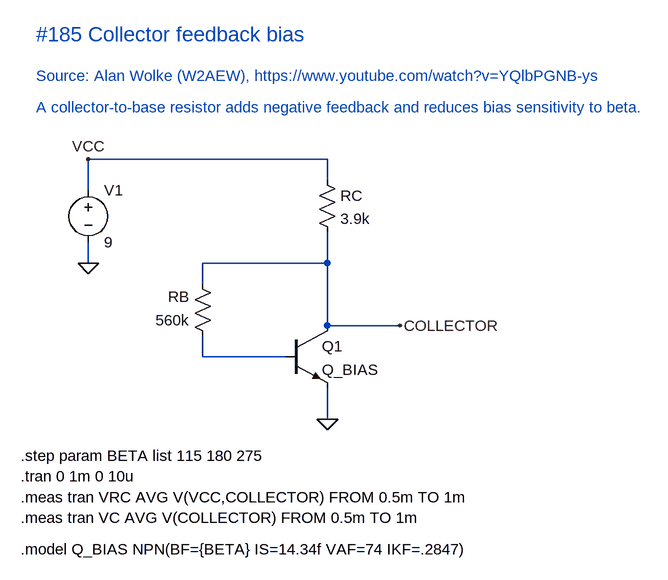
[diagram p0: schematic Collector Feedback Bias.asc]
Collector Feedback Bias.asc, the LTspice schematic file:
Version 4.1
SHEET 1 1056 980
WIRE 480 224 112 224
WIRE 480 256 480 224
WIRE 112 272 112 224
WIRE 112 384 112 352
WIRE 480 384 480 336
WIRE 480 384 288 384
WIRE 288 416 288 384
WIRE 480 480 480 384
WIRE 592 480 480 480
WIRE 288 528 288 496
WIRE 416 528 288 528
WIRE 480 624 480 576
FLAG 112 384 0
FLAG 112 224 VCC
FLAG 480 624 0
FLAG 592 480 COLLECTOR
SYMBOL voltage 112 256 R0
WINDOW 123 0 0 Left 0
WINDOW 39 0 0 Left 0
SYMATTR InstName V1
SYMATTR Value 9
SYMBOL res 464 240 R0
SYMATTR InstName RC
SYMATTR Value 3.9k
SYMBOL npn 416 480 R0
SYMATTR InstName Q1
SYMATTR Value Q_BIAS
SYMBOL res 304 512 R180
WINDOW 0 36 76 Left 2
WINDOW 3 36 40 Left 2
SYMATTR InstName RB
SYMATTR Value 560k
TEXT 32 32 Left 3 ;#185 Collector feedback bias
TEXT 32 96 Left 2 ;Source: Alan Wolke (W2AEW), https://www.youtube.com/watch?v=YQlbPGNB-ys
TEXT 32 144 Left 2 ;A collector-to-base resistor adds negative feedback and reduces bias sensitivity to beta.
TEXT 8 680 Left 2 !.step param BETA list 115 180 275
TEXT 8 712 Left 2 !.tran 0 1m 0 10u
TEXT 8 744 Left 2 !.meas tran VRC AVG V(VCC,COLLECTOR) FROM 0.5m TO 1m
TEXT 8 776 Left 2 !.meas tran VC AVG V(COLLECTOR) FROM 0.5m TO 1m
TEXT 8 824 Left 2 !.model Q_BIAS NPN(BF={BETA} IS=14.34f VAF=74 IKF=.2847)

The netlist it stands for:
* Collector Feedback Bias.asc
V1 VCC 0 9
RC VCC COLLECTOR 3.9k
Q1 COLLECTOR N001 0 0 Q_BIAS
RB N001 COLLECTOR 560k
.model NPN NPN
.model PNP PNP
.lib standard.bjt
* #185 Collector feedback bias
* Source: Alan Wolke (W2AEW), https://www.youtube.com/watch?v=YQlbPGNB-ys
* A collector-to-base resistor adds negative feedback and reduces bias sensitivity to beta.
.step param BETA list 115 180 275
.tran 0 1m 0 10u
.meas tran VRC AVG V(VCC,COLLECTOR) FROM 0.5m TO 1m
.meas tran VC AVG V(COLLECTOR) FROM 0.5m TO 1m
.model Q_BIAS NPN(BF={BETA} IS=14.34f VAF=74 IKF=.2847)
.backanno
.end